# Altium schematic sheet MEAS_SCHEME.SchDoc
size 549 x 325 mm; DocumentNumber: ТО2192; SheetNumber: 3; SheetTotal: 4
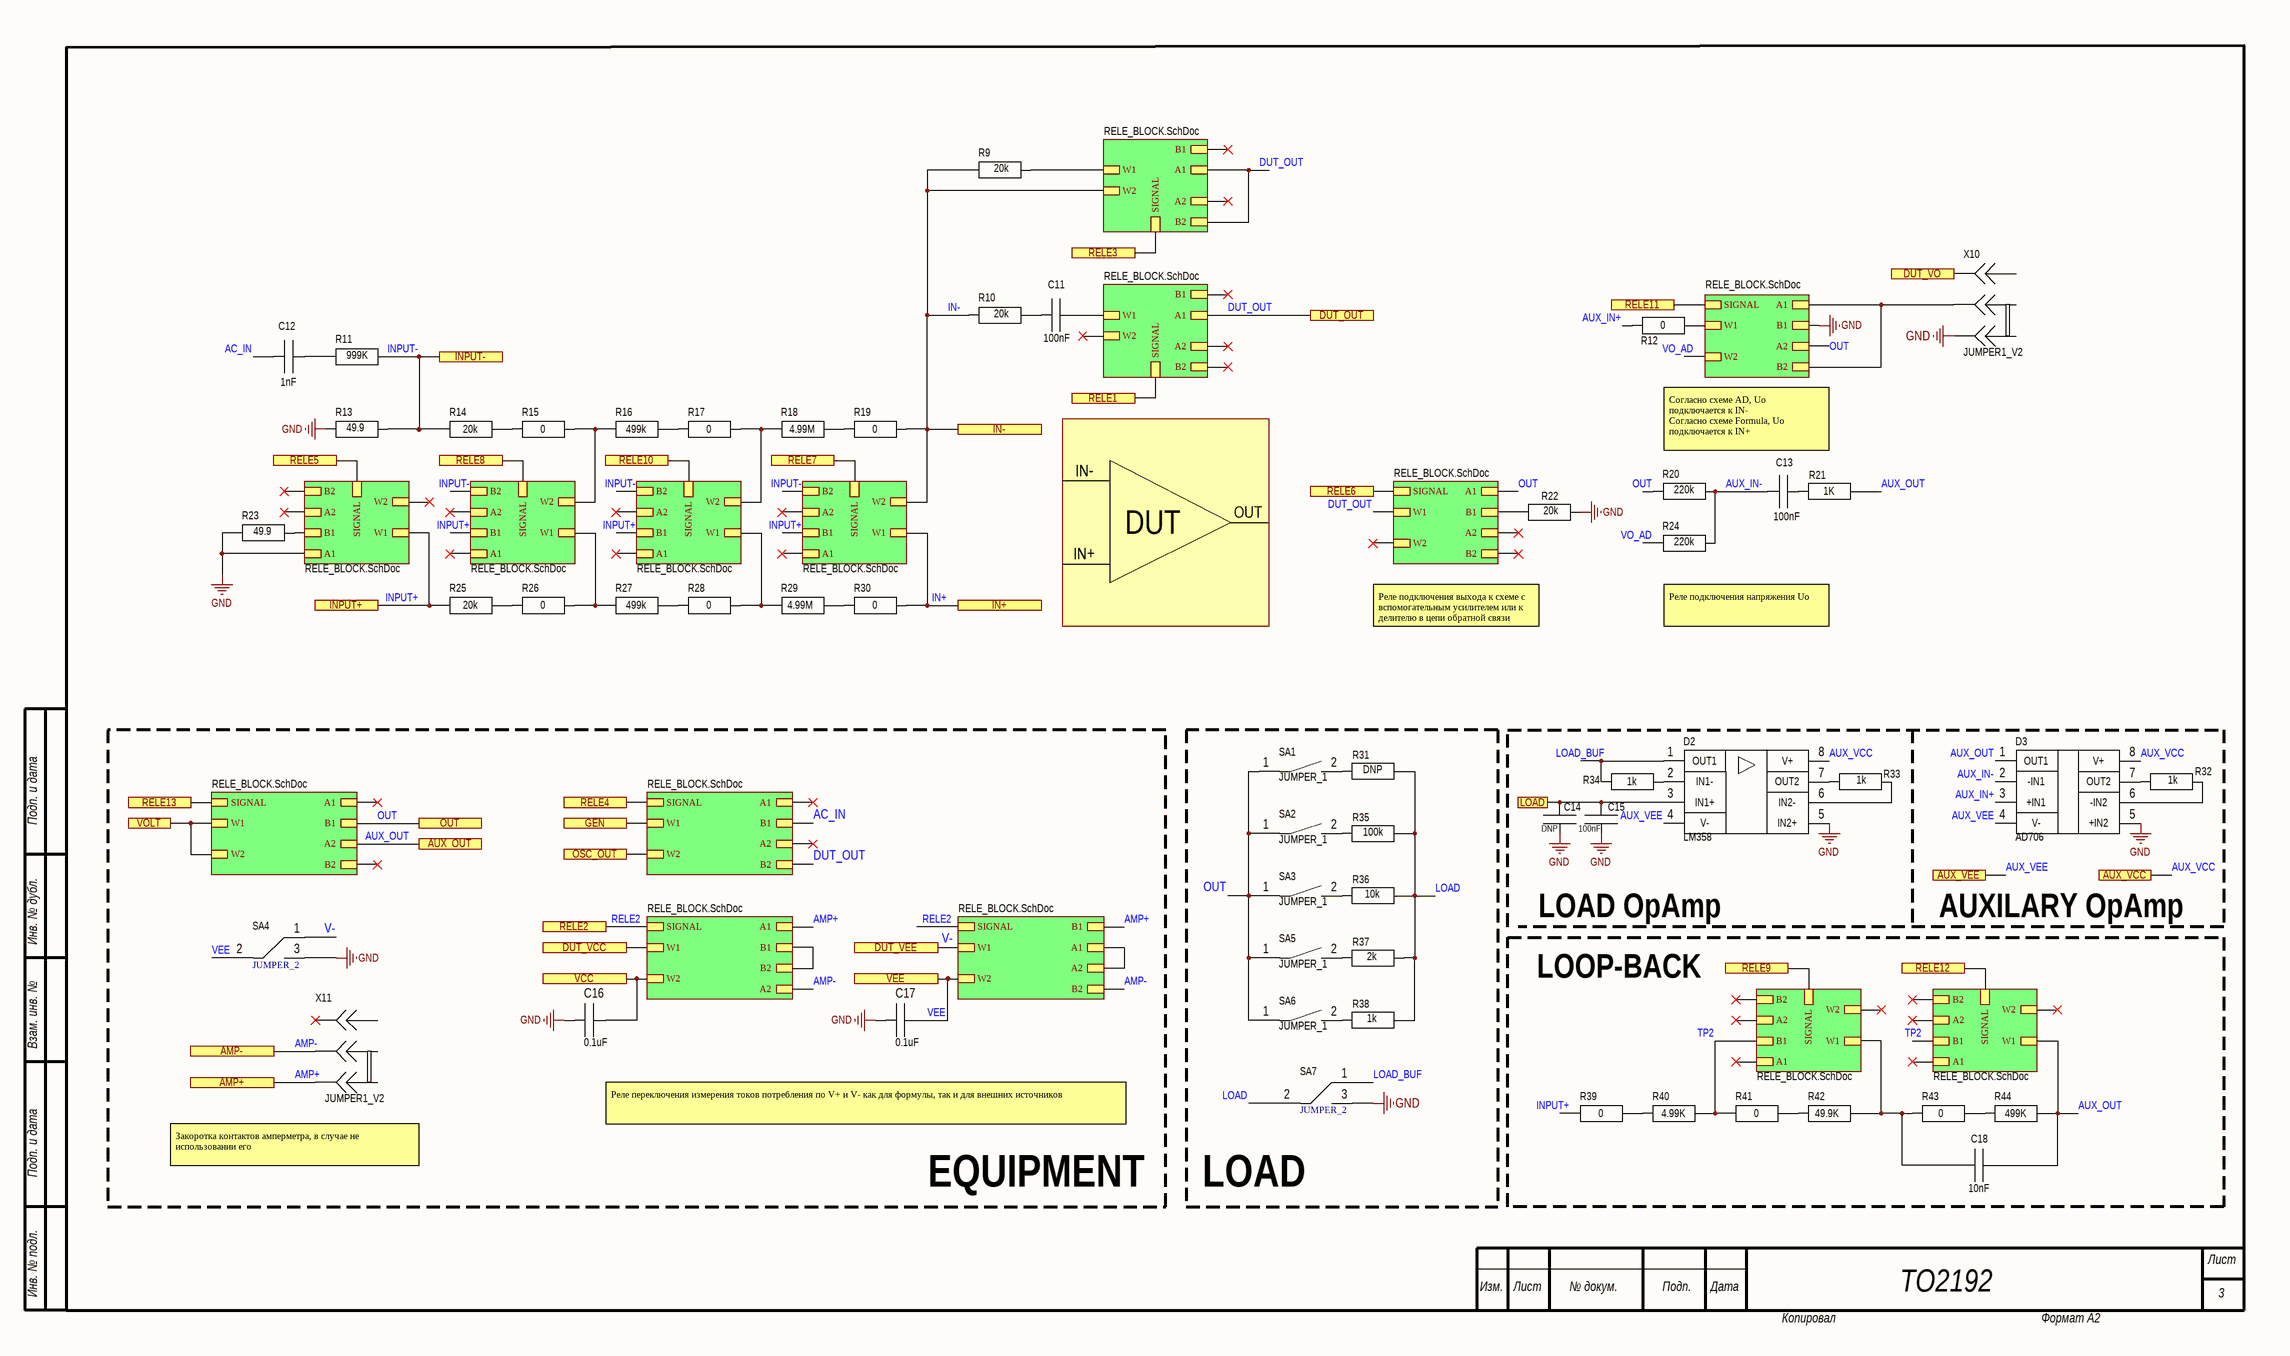
[diagram p0: MEAS_SCHEME.SchDoc]

## Parts
C11  100nF  [0805]
C12  1nF  [0805]
C13  100nF  [0805]
C14  DNP  [0805]
C15  100nF  [1210]
C16  0.1uF  [0805]
C17  0.1uF  [0805]
C18  10nF  [0805]
D2  LM358  [SOIC-8(R-8)]
D3  AD706  [SOIC-8(R-8)]
R9  20k  [0805]
R10  20k  [0805]
R11  999K  [0805]
R12  0  [1206]
R13  49.9  [0805]
R14  20k  [0805]
R15  0  [0805]
R16  499k  [0805]
R17  0  [0805]
R18  4.99M  [0805]
R19  0  [0805]
R20  220k  [1206]
R21  1K  [0805]
R22  20k  [0805]
R23  49.9  [0805]
R24  220k  [0805]
R25  20k  [0805]
R26  0  [0805]
R27  499k  [0805]
R28  0  [0805]
R29  4.99M  [0805]
R30  0  [0805]
R31  DNP  [0805]
R32  1k  [0805]
R33  1k  [0805]
R34  1k  [1206]
R35  100k  [0805]
R36  10k  [0805]
R37  2k  [0805]
R38  1k  [0805]
R39  0  [0805]
R40  4.99K  [0805]
R41  0  [0805]
R42  49.9K  [0805]
R43  0  [0805]
R44  499K  [0805]
SA1  JUMPER_1  [PLS2-2,54]
SA2  JUMPER_1  [PLS2-2,54]
SA3  JUMPER_1  [PLS2-2,54]
SA4  JUMPER_2  [PLS3-2,54]
SA5  JUMPER_1  [PLS2-2,54]
SA6  JUMPER_1  [PLS2-2,54]
SA7  JUMPER_2  [PLS3-2,54]
X10  JUMPER1_V2  [PLS3-2,54]
X11  JUMPER1_V2  [PLS3-2,54]

## Blocks framed on the sheet
EQUIPMENT: C16 C17 SA4 X11
LOAD: R31 R35-R38 SA1-SA3 SA5-SA7
LOOP-BACK: C18 R39-R44

## Sub-sheets
RELE = RELE_BLOCK.SchDoc: W2, A2, SIGNAL, A1, B2, W1, B1
RELE = RELE_BLOCK.SchDoc: W2, A2, SIGNAL, A1, B2, W1, B1
RELE = RELE_BLOCK.SchDoc: W2, A2, SIGNAL, A1, B2, W1, B1
RELE = RELE_BLOCK.SchDoc: W2, A2, SIGNAL, A1, B2, W1, B1
RELE = RELE_BLOCK.SchDoc: W2, A2, SIGNAL, A1, B2, W1, B1
RELE = RELE_BLOCK.SchDoc: W2, A2, SIGNAL, A1, B2, W1, B1
RELE = RELE_BLOCK.SchDoc: W2, A2, SIGNAL, A1, B2, W1, B1
RELE = RELE_BLOCK.SchDoc: W2, A2, SIGNAL, A1, B2, W1, B1
RELE = RELE_BLOCK.SchDoc: W2, A2, SIGNAL, A1, B2, W1, B1
RELE = RELE_BLOCK.SchDoc: W2, A2, SIGNAL, A1, B2, W1, B1
RELE = RELE_BLOCK.SchDoc: W2, A2, SIGNAL, A1, B2, W1, B1
RELE = RELE_BLOCK.SchDoc: W2, A2, SIGNAL, A1, B2, W1, B1
RELE = RELE_BLOCK.SchDoc: W2, A2, SIGNAL, A1, B2, W1, B1
RELE 1 = RELE_BLOCK.SchDoc: W2, A2, SIGNAL, A1, B2, W1, B1

## Ports
AMP+, AMP-, AUX_OUT, AUX_VCC, AUX_VEE, DUT_OUT, DUT_VCC, DUT_VEE, DUT_VO, GEN, IN+, IN-, INPUT+, INPUT-, LOAD, OSC_OUT, OUT, RELE1, RELE2, RELE3, RELE4, RELE5, RELE6, RELE7, RELE8, RELE9, RELE10, RELE11, RELE12, RELE13, VCC, VEE, VOLT

## Nets
GND: C14.2 C15.2 C16.2 C17.2 D2.5 D3.5 R13.2 R22.1 R23.2 SA4.3 SA7.3 X10.1 ; sheet RELE/A1, sheet RELE/B1
AC_IN: C12.2 ; sheet RELE/B1
AMP+: X11.1 ; port AMP+, sheet RELE/A1, sheet RELE/B1
AMP-: X11.2 ; port AMP-, sheet RELE/A2, sheet RELE/B2
AUX_IN+: D3.3 R12.2
AUX_IN-: C13.1 D3.2 R20.2 R24.2
AUX_OUT: C18.1 D3.1 R21.2 R44.1 ; port AUX_OUT, sheet RELE/W1, sheet RELE 1/A2
AUX_VCC: D2.8 D3.8 ; port AUX_VCC
AUX_VEE: D2.4 D3.4 ; port AUX_VEE
DUT_OUT: port DUT_OUT, sheet RELE/B2, sheet RELE/W1, sheet RELE/A1, sheet RELE/A1, sheet RELE/B2
DUT_VCC: port DUT_VCC, sheet RELE/W1
DUT_VO: X10.3 ; port DUT_VO
GEN: port GEN, sheet RELE/W1
IN+: R30.1 ; port IN+, sheet RELE/W1
IN-: R9.2 R10.2 R19.1 ; port IN-, sheet RELE/W2, sheet RELE/W2
INPUT+: R25.2 R39.2 ; port INPUT+, sheet RELE/B1, sheet RELE/B1, sheet RELE/B1, sheet RELE/W1
INPUT-: R11.1 R13.1 R14.2 ; port INPUT-, sheet RELE/B2, sheet RELE/B2, sheet RELE/B2
LOAD: R31.2 R35.2 R36.2 R37.2 R38.2 SA7.2
LOAD: C14.1 C15.1 D2.3 ; port LOAD  [a separate net that carries the same name]
LOAD_BUF: D2.1 R34.1 SA7.1
OSC_OUT: port OSC_OUT, sheet RELE/W2
OUT: R20.1 SA1.1 SA2.1 SA3.1 SA5.1 SA6.1 ; port OUT, sheet RELE/A2, sheet RELE/A1, sheet RELE 1/B1
RELE1: port RELE1, sheet RELE/SIGNAL
RELE2: port RELE2, sheet RELE/SIGNAL, sheet RELE/SIGNAL
RELE3: port RELE3, sheet RELE/SIGNAL
RELE4: port RELE4, sheet RELE/SIGNAL
RELE5: port RELE5, sheet RELE/SIGNAL
RELE6: port RELE6, sheet RELE/SIGNAL
RELE7: port RELE7, sheet RELE/SIGNAL
RELE8: port RELE8, sheet RELE/SIGNAL
RELE9: port RELE9, sheet RELE/SIGNAL
RELE10: port RELE10, sheet RELE/SIGNAL
RELE11: port RELE11, sheet RELE/SIGNAL
RELE12: port RELE12, sheet RELE/SIGNAL
RELE13: port RELE13, sheet RELE 1/SIGNAL
TP2: R40.1 R41.2 ; sheet RELE/B1, sheet RELE/B1
V-: SA4.1 ; port DUT_VEE, sheet RELE/W1
VCC: C16.1 ; port VCC, sheet RELE/W2
VEE: C17.1 SA4.2 ; port VEE, sheet RELE/W2
VO_AD: R24.1 ; sheet RELE/W2
VOLT: port VOLT, sheet RELE 1/W2, sheet RELE 1/W1
NetC11_1: C11.1 ; sheet RELE/W1
NetC11_2: C11.2 R10.1
NetC12_1: C12.1 R11.2
NetC13_2: C13.2 R21.1
NetC18_2: C18.2 R42.1 R43.2 ; sheet RELE/W1
NetD2_2: D2.2 R34.2
NetD2_6: D2.6 R33.1
NetD2_7: D2.7 R33.2
NetD3_6: D3.6 R32.1
NetD3_7: D3.7 R32.2
NetR9_1: R9.1 ; sheet RELE/W1
NetR12_1: R12.1 ; sheet RELE/W1
NetR14_1: R14.1 R15.2
NetR15_1: R15.1 R16.2 ; sheet RELE/W2
NetR16_1: R16.1 R17.2
NetR17_1: R17.1 R18.2 ; sheet RELE/W2
NetR18_1: R18.1 R19.2
NetR22_2: R22.2 ; sheet RELE/B1
NetR23_1: R23.1 ; sheet RELE/B1
NetR25_1: R25.1 R26.2
NetR26_1: R26.1 R27.2 ; sheet RELE/W1
NetR27_1: R27.1 R28.2
NetR28_1: R28.1 R29.2 ; sheet RELE/W1
NetR29_1: R29.1 R30.2
NetR31_1: R31.1 SA1.2
NetR35_1: R35.1 SA2.2
NetR36_1: R36.1 SA3.2
NetR37_1: R37.1 SA5.2
NetR38_1: R38.1 SA6.2
NetR39_1: R39.1 R40.2
NetR41_1: R41.1 R42.2
NetR43_1: R43.1 R44.2
NetX10_2: X10.2 ; sheet RELE/A1, sheet RELE/B2
(unnamed): sheet RELE/B2, sheet RELE/B1
(unnamed): sheet RELE/A2, sheet RELE/A1

Not connected (* = marked no-connect by the designer): X11 3*

## Notes on the sheet
- IN-
- Согласно схеме AD, Uo подключается к IN-
  Согласно схеме Formula, Uo подключается к IN+
- DUT
- OUT
- IN+
- Реле подключения выхода к схеме с вспомогательным усилителем или к делителю в цепи обратной связи
- (near R24) Реле подключения напряжения Uo
- Подп. и дата
- Инв. № дубл.
- LOAD OpAmp
- AUXILARY OpAmp
- Взам. инв. №
- (near X11) Закоротка контактов амперметра, в случае не использовании его
- Реле переключения измерения токов потребления по V+ и V- как для формулы, так и для внешних источников
- Лист
- Инв. № подл.
- Изм.
- № докум.
- Подп.
- Дата
- ТО2192
- 3
- Копировал
- Формат А2
- DWG. NO.
- REV.
- SHT.
- REVISION
- DESCRIPTION
- DATE
- APPROVED
- THIS DOCUMENT AND THE DATA DISCLOSED HEREIN OR HEREWITH IS THE PROPERTY OF ALTIUM LIMITED AND MAY BE FREELY DISTRIBUTED IN WHOLE. NO RIGHTS ARE RESERVED OR EXPRESS OR IMPLIED WARANTEE GIVEN.
- ENG:
- DSN:
- APPROVALS
- PROJECT
- DOCUMENT REVISION:
- DESIGN ITEM:
- CHK:
- BOM:
- REFERENCE DOCUMENTS
- PROJECT REVISION:
- TITLE
- FAB DWG:
- PCB DWG:
- ASSY DWG:
- SCALE:
- SIZE
- C
- CAGE CODE
- FILE NAME
- DWG NO.
- SHEET
- OF
- REV
- (in symbol AD706) OUT1; V+; -IN1; OUT2; +IN1; -IN2; V-; +IN2
- (in symbol LM358) OUT1; V+; IN1-; OUT2; IN1+; IN2-; V-; IN2+

## Library data of the parts
C11-C14 C16-C18 = C0805: ComponentHeigt: 1.3; Firme: AVX; Leadform: SMD; KIND: Конденсатор; ClassName: *; Component Link: *; ComponentWeigt: *; Packaging: 0805; NN: *; Value: *
C15 = C1210: ComponentHeigt: 1.3; Firme: AVX; Leadform: SMD; KIND: Конденсатор; ClassName: *; Component Link: *; ComponentWeigt: *; Packaging: 0805; NN: *; Value: *
R9-R11 R13-R19 R21-R23 R25-R33 R35-R44 = R0805 Yageo: ComponentHeigt: 0.6; Firme: Yageo; Leadform: SMD; Kind: Резистор; ClassName: *; ComponentWeigt: *; Component Link: *; Packaging: 0805; NN: *; Value: *
R12 R20 R34 = R1206 Yageo: ComponentHeigt: 0.6; Firme: Yageo; Leadform: SMD; Kind: Резистор; ClassName: *; ComponentWeigt: *; Component Link: *; Packaging: 0805; NN: *; Value: *
R24 = R0805 Yageo: По схеме AD 220k, по схеме Formula 10k; ComponentHeigt: 0.6; Firme: Yageo; Leadform: SMD; Kind: Резистор; ClassName: *; ComponentWeigt: *; Component Link: *; Packaging: 0805; NN: *; Value: *